# Altium schematic sheet Buck_Converter.SchDoc
size A4; SheetNumber: 1; SheetTotal: 1
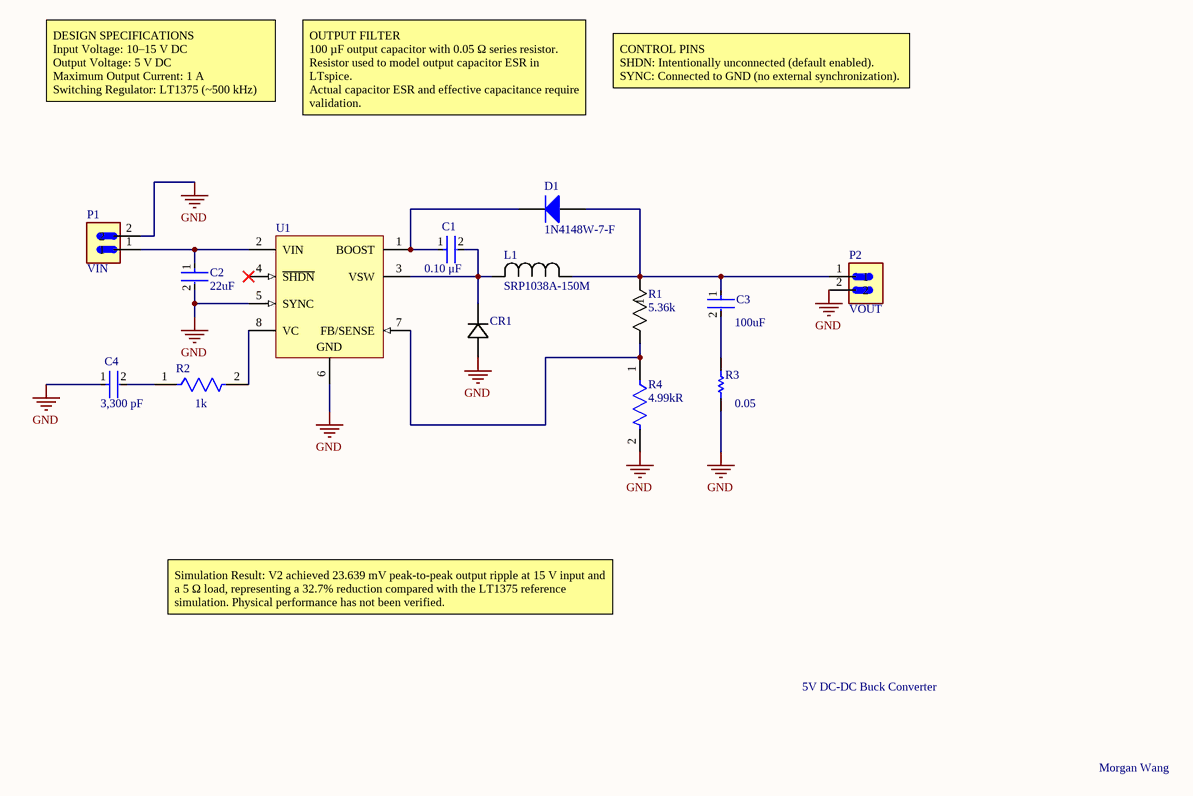
[diagram p0: Buck_Converter.SchDoc]

## Parts
C1  value 0.10 μF  [FP-C0603C-CF-MFG]  (hidden comment: C0603C104K5RACTU)
C2  Capacitance: 22uF  [FP-C1210C226M3RACTU-MFG]  (hidden comment: C1210C226M3RACTU)
C3  Capacitance: 100uF  [FP-C1210C-FS-MFG]  (hidden comment: C1210C107M4PACTU)
C4  Capacitance: 3,300 pF  [FP-C0603C-CF-MFG]  (hidden comment: C0603C332K5RACTU)
CR1  SS2040FL_R1_00001  [CR_R1_00001_PNJ]  (value not drawn)
D1  1N4148W-7-F  [DIOD-SOD123-2_V]
L1  SRP1038A-150M  [IND_SRP1038A_BRN]
P1  VIN  [JST_S2B-PH-SM4-TB]
P2  VOUT  [JST_S2B-PH-SM4-TB]
R1  value 5.36k  [STA_RMCF0603_STP]  (hidden comment: RMCF0603FT5K36)
R2  Resistance: 1k  [FP-RMCF0603-MFG]  (hidden comment: RMCF0603FT1K00)
R3  value 0.05  [RESC1508X46X38LL25T25]  (hidden comment: WSL0603R0500FEA18)
R4  Resistance: 4.99kR  [FP-RMCF0603-IPC_B]  (hidden comment: RMCF0603FT4K99)
U1  LT1375CS8#PBF  [LT-S8-8_L]  (value not drawn)

## Nets
GND: C2.2 C4.1 CR1.2 P1.2 P2.2 R3.2 R4.2 U1.5(SYNC) U1.6(GND)
NetC1_1: C1.1 D1.2(K) U1.1(BOOST)
NetC1_2: C1.2 CR1.1 L1.2 U1.3(VSW)
NetC2_1: C2.1 P1.1 U1.2(VIN)
NetC3_1: C3.1 D1.1(A) L1.1 P2.1 R1.1
NetC3_2: C3.2 R3.1
NetC4_2: C4.2 R2.1
NetR1_2: R1.2 R4.1 U1.7(FB/SENSE)
NetR2_2: R2.2 U1.8(VC)

Not connected (* = marked no-connect by the designer): U1 4(~{SHDN})*

## Notes on the sheet
- CONTROL PINS
  SHDN: Intentionally unconnected (default enabled).
  SYNC: Connected to GND (no external synchronization).
- DESIGN SPECIFICATIONS
  Input Voltage: 10–15 V DC
  Output Voltage: 5 V DC
  Maximum Output Current: 1 A
  Switching Regulator: LT1375 (~500 kHz)
- OUTPUT FILTER
  100 µF output capacitor with 0.05 Ω series resistor.
  Resistor used to model output capacitor ESR in LTspice.
  Actual capacitor ESR and effective capacitance require validation.
- Simulation Result: V2 achieved 23.639 mV peak-to-peak output ripple at 15 V input and a 5 Ω load, representing a 32.7% reduction compared with the LT1375 reference simulation. Physical performance has not been verified.
- 5V DC-DC Buck Converter
- Morgan Wang

## Library data of the parts
C1 = CMP-2006-03061-2: CAP CER 0.1UF 50V X7R 0603; Manufacturer: KEMET; Tolerance: 0.1; Description: C0603 0.10 μF X7R 30ppm/°C 10.00% 50 V; Temperature Coefficient: 30ppm/°C; Material: Ceramic; Automotive Grade: Grade 1; Temperature: -55°C to +125°C; RoHS: TRUE; Temperature Range High: +125°C; Lead Free: Yes; Octopart: https://octopart.com/c0603c104k5ractu-kemet-139244; Digikey Description: CAP CER 0.1UF 50V X7R 0603; Category: Cap; Package: C0603C-CF; ComponentLink2Description: Datasheet; Temperature Range Low: -55°C; Device Class L1: Passive Components; Voltage Rating: 50 V; Automotive: Yes; Device Class L3: Ceramic Capacitors; ComponentLink2URL: https://api.kemet.com/component-edge/download/datasheet/C0603C100J5GACAUTO.pdf; Capacitance: 0.10 μF; Device Class L2: Capacitors; Manufacturer Part Number: C0603C104K5RACTU; Temperature Characteristic: X7R; Height: 0.87mm
C2 = CMP-03020-034666-1: CAP CER 22UF 25V X7R 1210; Dielectric Material: Ceramic; Dissipation Factor: 5%; Tolerance: 20%; Height: 2.5mm; Case Code (Imperial): 1210; Case Code (Metric): 3225; Thickness: 0.11inch; Width: 2.5mm; Depth: 2.5mm; Length: 3.2mm; Max Operating Temperature: 125°C; Dielectric: X7R; Packaging: Tape and Reel; REACH SVHC: No SVHC; Voltage Rating (DC): 25V; Termination: SMD/SMT; Case/Package: 1210; Min Operating Temperature: -55°C; Package Quantity: 1; Voltage: 25V; Voltage Rating: 25V; Mount: Surface Mount; Series: C
C3 = CMP-03020-034653-1: CAP CER 100UF 16V X5R 1210; Tolerance: 20%; Dielectric Material: Ceramic; Max Operating Temperature: 85°C; REACH SVHC: No SVHC; Case Code (Metric): 3225; Case/Package: 1210; Thickness: 0.106inch; Length: 3.2mm; Min Operating Temperature: -55°C; Voltage Rating (DC): 16V; Weight: 0.000564oz; Packaging: Tape and Reel; Case Code (Imperial): 1210; Depth: 2.5mm; Lead Free: Lead Free; Width: 0.098inch; Voltage Rating: 16V; Termination: SMD/SMT; Dielectric: X5R; Package Quantity: 1000
C4 = CMP-2006-03179-2: CAP CER 3300PF 50V X7R 0603; Manufacturer: KEMET; Description: C0603 3,300 pF X7R 30ppm/°C 10.00% 50 V; Temperature Coefficient: 30ppm/°C; Automotive Grade: Grade 1; Value: 3,300 pF; Tolerance: 0.1; Material: Ceramic; Temperature Range High: +125°C; Voltage Rating: 50 V; Height: 0.87mm; Temperature Range Low: -55°C; Digikey Description: CAP CER 3300PF 50V X7R 0603; Automotive: Yes; Temperature: -55°C to +125°C; Package: C0603C-CF; Device Class L1: Passive Components; Lead Free: Yes; Temperature Characteristic: X7R; Device Class L2: Capacitors; Category: Cap; Manufacturer Part Number: C0603C332K5RACTU; ComponentLink2Description: Datasheet; Device Class L3: Ceramic Capacitors; RoHS: TRUE; Mouser Description: Multilayer Ceramic Capacitors MLCC - SMD/SMT 50volts 3300pF X7R 10%; Octopart: https://octopart.com/c0603c332k5ractu-kemet-135923; ComponentLink2URL: https://api.kemet.com/component-edge/download/datasheet/C0603C100J5GACAUTO.pdf
CR1 = SS2040FL_R1_00001: Description; Manufacturer_Name: Panjit; Copyright: Copyright (C) 2026 Ultra Librarian. All rights reserved.; Manufacturer_Part_Number: SS2040FL_R1_00001
D1 = CMP-2000-04932-2: Fast Switching Diode, 100 V, 0.15 A, -65 to 150 degC, 2-Pin?SOD123, RoHS, Tape and Reel; Recovery Time: 4ns; Brand: DiodesIncorporated; Unit Weight: 0.000353oz; Max Surge Current: 2A; Peak Reverse Voltage: 100V; Ir - Reverse Current: 1uA; Vf - Forward Voltage: 1.25V; Configuration: Single; If - Forward Current: 0.15A; Product Category: Diodes-GeneralPurpose,Power,Switching; Operating Temperature Range: -65Cto+150C; Packaging: Reel; Manufacturer URL: http://www.diodes.com/; Maximum Operating Temperature: +150C; Height: 1.25mm; Minimum Operating Temperature: -65C; Product: SwitchingDiodes; Package URL: http://www.diodes.com/datasheets/ds18004.pdf; Type: SwitchingDiode; Package Reference: SOD123-2; Width: 1.7mm; Datasheet URL: http://www.farnell.com/datasheets/1915529.pdf; Datasheet Version: Rev. 24-2, 10/2013; Series: 1N4148; Factory Pack Quantity: 3000; Length: 2.85mm; RoHS: True; Manufacturer: DiodesIncorporated; Mounting Style: SMD/SMT; Package / Case: SOD-123
L1 = SRP1038A-150M: Description; Manufacturer_Name: Bourns Electronics; Type: Fixed Inductors; Copyright: Copyright (C) 2025 Ultra Librarian. All rights reserved.; Manufacturer_Part_Number: SRP1038A-150M
P1 P2 = S2B-PH-SM4-TB: Connector Header Surface Mount, Right Angle 2 position 0.079 (2.00mm); MF: JST Sales; SnapEDA_Link: https://www.snapeda.com/parts/S2B-PH-SM4-TB/JST/view-part/?ref=snap; Package: None; Value: *; MP: S2B-PH-SM4-TB; Check_prices: https://www.snapeda.com/parts/S2B-PH-SM4-TB/JST/view-part/?ref=eda
R1 = RMCF0603FT5K36: No Description Available; Manufacturer_Name: Stackpole International; Copyright: Copyright (C) 2026 Ultra Librarian. All rights reserved.; Manufacturer_Part_Number: RMCF0603FT5K36; Digi-Key_Part_Number_1: RMCF0603FT5K36CT-ND; Digi-Key_Part_Number_2: RMCF0603FT5K36DKR-ND; Digi-Key_Part_Number_3: RMCF0603FT5K36TR-ND
R2 = CMP-26527-000152-1: 1kΩ ±1% 0.1W 0603 Thick Film Chip Resistor AEC-Q200 compliant; Max Power Dissipation: 100mW; Temperature Coefficient: 100ppm/°C; Packaging: Tape and Reel; Mount: Surface Mount; RoHS Compliant: Yes; Construction: Rectangular; Width: 0.031inch; Case Code (Imperial): 0603; Contact Plating: Tin; Length: 1.55mm; Lead Free: Lead Free; Case Code (Metric): 1608; Size Code: 0603; Depth: 0.8mm; Series: RMCF; Power Rating: 100mW; Height: 0.022inch; Case/Package: 0603; Tolerance: 1%; Min Operating Temperature: -55°C; Military Standard: Not; Features: Automotive AEC-Q200; Max Operating Temperature: 155°C; Number of Terminations: 2; Radiation Hardening: No; Resistor Type: Thick Film
R3 = CMP-2000-03813-1: Manufacturer: Vishay Dale; Part Number: WSL0603R0500FEA18
R4 = CMP-26527-001870-1: 4.99kΩ ±1% 0.1W 0603 Thick Film Chip Resistor AEC-Q200 compliant; Max Power Dissipation: 100mW; Temperature Coefficient: 100ppm/°C; Working Voltage: 75V; Radiation Hardening: No; Depth: 0.8mm; Case/Package: 0603; Height: 0.022inch; Mount: Surface Mount; Number of Terminations: 2; Packaging: Tape and Reel; Power Rating: 100mW; Package Quantity: 1; Width: 0.031inch; Series: RMCF; Min Operating Temperature: -55°C; Length: 1.55mm; Case Code (Imperial): 0603; Lead Free: Lead Free; Technology: THICK FILM; Max Operating Temperature: 155°C; Contact Plating: Tin; Construction: Rectangular; Features: Automotive AEC-Q200; Tolerance: 1%; Case Code (Metric): 1608; Resistor Type: Thick Film; Military Standard: Not; RoHS Compliant: Yes
U1 = CMP-0491-01961-1: 1.5 A, 500 kHz Step-Down Switching Regulator, 8-pin SOIC (S8-8), 0 to 125 degC, Pb-Free; Manufacturer: Linear Technology; Frequency Sync Range: 580kHz - 900kHz; Number of Outputs: 1; RoHS: TRUE; ComponentLink1URL: http://www.linear.com/; PackageReference: S8-8; PartNumber: LT1375CS8#PBF; DatasheetVersion: Rev. D; Mounting Technology: Surface Mount; ComponentLink1Description: Manufacturer URL; ComponentLink3Description: Package Specification; ComponentLink2URL: http://cds.linear.com/docs/en/datasheet/13756fd.pdf; ComponentLink2Description: Datasheet; PackageVersion: Rev. G, 03/2012; ComponentLink3URL: http://cds.linear.com/docs/en/packaging/05081610_G_SO8.pdf; PackageDescription: 8-Pin Plastic Small Outline (Narrow .150 Inch), Body 4.9 x 3.9 mm, Pitch 1.27 mm